# EasyEDA Pro project trumpx-ipadrescreen-ipad34-c6ab9950.epro, board PCB_C
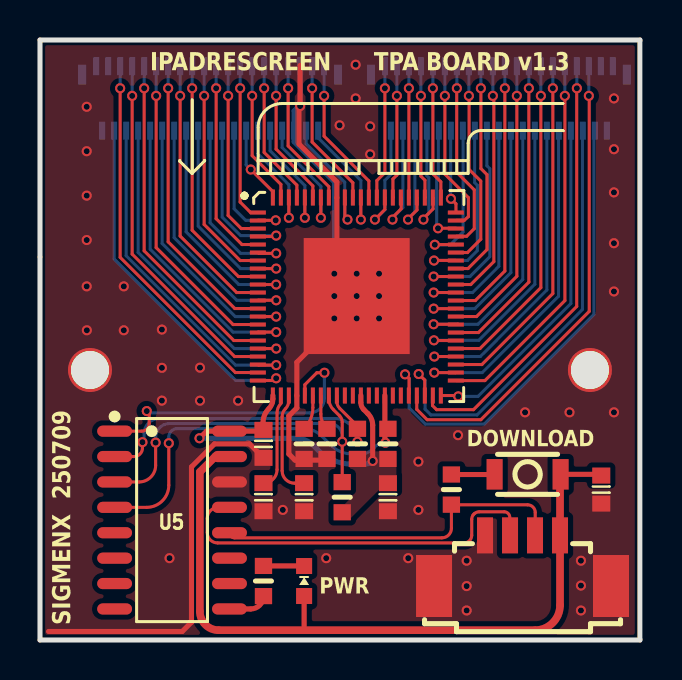
[diagram p8: board, top side]
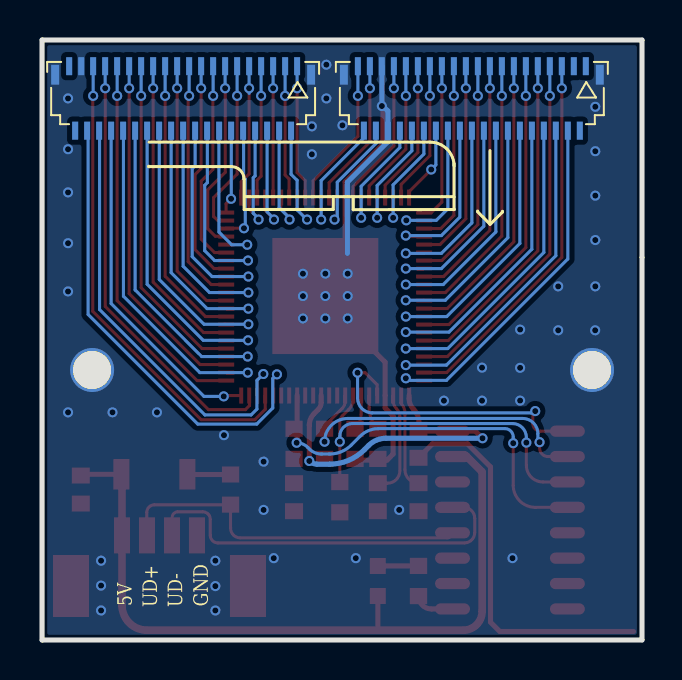
[diagram p9: board, bottom side, seen from below]

Outline 30 x 30 mm; copper layers: Top Layer, Bottom Layer. Coordinates in mm from the lower left corner of the outline.
Outline path: 0,19.15 0,30 30,30 30,0 0,0 0,19.15
Stack: Top Layer 0.035mm / Dielectric1 1.51mm FR4 er 4.5 / Bottom Layer 0.035mm

## Design rules (mm)
spacing copperThickness1oz (default): track to track 0.102, other pairs 0.152 to 0.3
spacing copperThickness2oz: track to track 0.203, other pairs 0.152 to 0.3
spacing Plane_innerPlane: track to track 0.102, other pairs 0.152 to 0.3
spacing Copper_copperRegion: track to track 0.102, other pairs 0.152 to 0.3
track width copperThickness1oz (default): min 0.127, default 0.254, max 2.54
track width copperThickness2oz: min 0.203, default 0.254, max 2.54
differential pair differentialPair (default): width min 0.127, default 0.254, max 2.54; gap min 0.152, default 0.152
pour e641 uses Copper_copperRegion
pour e643 uses Copper_copperRegion
pour e649 uses Copper_copperRegion

## Placement (name value [footprint] x y rotation side)
C1  2.2uF  [c0603_neo]  11.18 9.81 90 top
C2  2.2uF  [c0603_neo]  11.18 7.14 90 top
C3  2.2uF  [c0603_neo]  13.21 7.14 90 top
C5  100nF  [c0603_neo]  28.07 7.52 90 top
C6  100nF  [c0603_neo]  17.4 7.14 90 top
FPC2  1.25-4PWB  [CONN-SMD_1.25-4PWB]  24.13 3.97 0 top
LED1  KT-0603W  [LED0603]  13.21 2.95 90 top
NOREF  -  [Pad_e132]  27.5 13.5 0 top
NOREF#2  -  [Pad_e131]  2.5 13.5 0 top
R1  10kΩ  [r0603_neo]  20.57 7.52 90 top
R2  4.7K  [r0603_neo]  15.11 7.14 270 top
R3  4.7K  [r0603_neo]  15.88 9.81 270 top
R4  10K  [r0603_neo]  17.4 9.81 90 top
R5  1kΩ  [r0603_neo]  13.21 9.81 270 top
R6  1kΩ  [r0603_neo]  14.35 9.81 270 top
R7  1kΩ  [r0603_neo]  11.18 2.95 270 top
U1  -  [GT9110]  15.85 17.17 0 top
U2  FH26-39S-0.3SHW  [CONN-SMD_FH26-39S-0.3SHW]  22.95 27.08 0 bottom
U3  FH26-39S-0.3SHW  [CONN-SMD_FH26-39S-0.3SHW]  8.51 27.08 0 bottom
U4  TS2306A 200gf 002  [SW-SMD_L3.0-W2.0-LS3.5]  24.38 8.28 0 top
U5  CH554G  [SOP-16_L10.0-W3.9-P1.27-LS6.0-BL]  6.6 6 270 top

## Footprints (pads in the part's own frame, mm; a bottom-side part is the same pattern mirrored in y, then rotated)
c0603_neo
  rect 0.8x0.9 smd: 1(-0.7,0) 2(0.7,0)
CONN-SMD_1.25-4PWB
  rect 0.8x1.8 smd: 1(-1.875,1.266) 2(-0.625,1.266) 3(0.625,1.266) 4(1.875,1.266)
  rect 1.8x3.1 smd: 5(-4.425,-1.266) 6(4.425,-1.266)
CONN-SMD_FH26-39S-0.3SHW
  rect 0.3x0.9 smd: 1(-5.699,-1.613) 2(-5.399,1.613) 3(-5.099,-1.613) 4(-4.8,1.613) 5(-4.5,-1.613) 6(-4.199,1.613) 7(-3.9,-1.613) 8(-3.6,1.613) 9(-3.3,-1.613) 10(-3,1.613) 11(-2.7,-1.613) 12(-2.4,1.613) 13(-2.1,-1.613) 14(-1.8,1.613) 15(-1.5,-1.613) 16(-1.2,1.613) 17(-0.9,-1.613) 18(-0.6,1.613) 19(-0.3,-1.613) 20(0,1.613) 21(0.299,-1.613) 22(0.6,1.613) 23(0.899,-1.613) 24(1.2,1.613) 25(1.5,-1.613) 26(1.8,1.613) 27(2.1,-1.613) 28(2.4,1.613) 29(2.7,-1.613) 30(2.999,1.613) 31(3.3,-1.613) 32(3.599,1.613) 33(3.9,-1.613) 34(4.199,1.613) 35(4.5,-1.613) 36(4.8,1.613) 37(5.099,-1.613) 38(5.399,1.613) 39(5.699,-1.613)
  rect 0.4x1 smd: 40(-6.399,-1.188) 41(6.399,-1.188)
GT9110
  rect 0.8x0.2 smd: 1(-4.95,4.2) 2(-4.95,3.8) 3(-4.95,3.4) 4(-4.95,3) 5(-4.95,2.6) 6(-4.95,2.2) 7(-4.95,1.8) 8(-4.95,1.4) 9(-4.95,1) 10(-4.95,0.6) 11(-4.95,0.2) 12(-4.95,-0.2) 13(-4.95,-0.6) 14(-4.95,-1) 15(-4.95,-1.4) 16(-4.95,-1.8) 17(-4.95,-2.2) 18(-4.95,-2.6) 19(-4.95,-3) 20(-4.95,-3.4) 21(-4.95,-3.8) 22(-4.95,-4.2) 45(4.95,-4.2) 46(4.95,-3.8) 47(4.95,-3.4) 48(4.95,-3) 49(4.95,-2.6) 50(4.95,-2.2) 51(4.95,-1.8) 52(4.95,-1.4) 53(4.95,-1) 54(4.95,-0.6) 55(4.95,-0.2) 56(4.95,0.2) 57(4.95,0.6) 58(4.95,1) 59(4.95,1.4) 60(4.95,1.8) 61(4.95,2.2) 62(4.95,2.6) 63(4.95,3) 64(4.95,3.4) 65(4.95,3.8) 66(4.95,4.2)
  rect 0.2x0.8 smd: 23(-4.2,-4.95) 24(-3.8,-4.95) 25(-3.4,-4.95) 26(-3,-4.95) 27(-2.6,-4.95) 28(-2.2,-4.95) 29(-1.8,-4.95) 30(-1.4,-4.95) 31(-1,-4.95) 32(-0.6,-4.95) 33(-0.2,-4.95) 34(0.2,-4.95) 35(0.6,-4.95) 36(1,-4.95) 37(1.4,-4.95) 38(1.8,-4.95) 39(2.2,-4.95) 40(2.6,-4.95) 41(3,-4.95) 42(3.4,-4.95) 43(3.8,-4.95) 44(4.2,-4.95) 67(4.2,4.95) 68(3.8,4.95) 69(3.4,4.95) 70(3,4.95) 71(2.6,4.95) 72(2.2,4.95) 73(1.8,4.95) 74(1.4,4.95) 75(1,4.95) 76(0.6,4.95) 77(0.2,4.95) 78(-0.2,4.95) 79(-0.6,4.95) 80(-1,4.95) 81(-1.4,4.95) 82(-1.8,4.95) 83(-2.2,4.95) 84(-2.6,4.95) 85(-3,4.95) 86(-3.4,4.95) 87(-3.8,4.95) 88(-4.2,4.95)
  rect 5.3x5.8 smd: 89(-0.009,0.024)
LED0603
  rect 0.8x0.8 smd: 1(-0.75,0) 2(0.75,0)
Pad_e131
  round 2.2 hole 1.9: 1(0,0)
Pad_e132
  round 2.2 hole 1.9: 1(0,0)
r0603_neo
  rect 0.806x0.864 smd: 1(-0.753,0) 2(0.753,0)
SOP-16_L10.0-W3.9-P1.27-LS6.0-BL
  oval 0.56x1.745 smd: 1(-4.445,-2.873) 2(-3.175,-2.873) 3(-1.905,-2.873) 4(-0.635,-2.873) 5(0.635,-2.873) 6(1.905,-2.873) 7(3.175,-2.873) 8(4.445,-2.873) 9(4.445,2.873) 10(3.175,2.873) 11(1.905,2.873) 12(0.635,2.873) 13(-0.635,2.873) 14(-1.905,2.873) 15(-3.175,2.873) 16(-4.445,2.873)
SW-SMD_L3.0-W2.0-LS3.5
  rect 0.8x1.524 smd: 1(-1.651,0) 2(1.651,0)

## Nets
As in the schematic, except:
GND: C1.1 C2.1 C3.1 C5.1 C6.1 FPC2.1 FPC2.5 FPC2.6 NOREF.1 NOREF#2.1 R5.2 R6.2 U1.26 U1.80 U1.89 U2.37 U2.40 U2.41 U3.34 U3.35 U3.40 U3.41 U5.14

Pads without a net: U1 32 33 35 36 38 39; U2 38 39; U3 1 2; U5 5 6 7 8 10 11

## Via types
v1: diameter 0.505, hole 0.305, Top Layer to Bottom Layer, 130 vias

## Routing (per net, layer and track width the routed paths; a pad name or vN(x,y) marks a point on that pad's centre or on a via; arc(x,y) is an arc through that point)
+5V: length 38.1
  Top Layer w0.254: 13.21,1.95 13.21,0.51 13.22,0.49 ; C5.2 28,8.28 U4.2
  Top Layer w0.381: U5.15 8.76,9.17 8,8.4 8,1.43 arc(8.27,0.77) 8.94,0.49 24.75,0.49 arc(25.64,0.86) 26,1.74 FPC2.4 26,8.25 U4.2
GND: length 53.9
  Top Layer w0.254: C1.1 10.48,9.81 8.73,9.81 7.58,8.66 7.58,0.89 7.11,0.43 0.43,0.43 ; 13.01,28.73 v1(13.01,26.7) 12.95,26.64 12.95,24.79 14.85,22.9 U1.80 14.85,18.19 v1(15.84,17.2) 15.84,16.88 12.85,13.89 U1.26 12.85,11.6 12.45,11.2 12.45,9.3 12.75,8.99 14.29,8.99 R6.2 ; 11.23,9.14 11.22,9.15
  Bottom Layer w0.254: U3.35 v1(13.01,26.7) 12.95,26.7 12.71,26.45 U3.34 12.71,24.91 14.73,22.89 14.73,19.33
  vias: v1(2.34,26.66) v1(2.34,24.44) v1(2.34,22.22) v1(2.34,20) v1(2.34,17.68) v1(2.34,15.49) v1(4.19,17.68) v1(4.19,15.49) v1(6.1,15.52) v1(6.1,13.61) v1(6.1,11.97) v1(6.48,4.09) v1(8,13.62) v1(8,11.97) v1(9.91,11.97) v1(12.14,6.5) v1(14.31,4.09) v1(14.72,18.32) v1(14.72,17.2) v1(14.72,16.08) v1(14.98,25.73) v1(15.78,28.77) v1(15.78,27.08) v1(15.84,18.32) v1(15.84,16.08) v1(16.51,25.68) v1(16.51,24.28) v1(16.96,18.32) v1(16.96,17.2) v1(16.96,16.08) v1(18.41,4.09) v1(18.92,8.92) v1(18.92,6.5) v1(20.91,10.24) v1(21.34,3.97) v1(21.34,2.7) v1(21.34,1.48) v1(24.26,11.38) v1(26.48,11.38) v1(27.05,3.97) v1(27.05,2.72) v1(27.05,1.48) v1(28.7,27.08) v1(28.7,24.54) v1(28.7,22.38) v1(28.7,19.84) v1(28.7,17.43) v1(28.7,11.38)
VDD33: length 17.6
  Top Layer w0.254: 11.11,10.44 U5.16 8.33,10.44 v1(7.98,10.09) ; v1(16.64,8.95) 16.64,10.74 arc(16.58,11.05) 16.4,11.31 16.19,11.52 arc(16.08,11.68) 16.05,11.88 U1.34 ; 11.15,10.53 11.15,10.86 arc(11.23,11.24) 11.44,11.56 arc(11.59,11.79) 11.65,12.05 11.65,12.22
  Bottom Layer w0.254: v1(7.98,10.09) 12.8,10.09 arc(13.27,9.99) 13.66,9.73 13.89,9.51 arc(14.68,8.98) 15.62,8.79 16.25,8.79 arc(16.46,8.83) v1(16.64,8.95)
INT: length 15
  Top Layer w0.152: U1.27 13.25,12.77 13.84,13.36 v1(14.22,13.36) ; U5.1 5.08,10.44 arc(5.35,10.55) 5.46,10.82 5.46,11.32 arc(5.42,11.4) v1(5.34,11.45)
  Bottom Layer w0.152: v1(5.34,11.45) 5.46,11.45 5.54,11.36 13.49,11.36 arc(14.01,11.57) 14.22,12.09 v1(14.22,13.36)
MT_IN0: length 18
  Top Layer w0.152: U1.22 11.7,12.97 v1(11.81,13.09)
  Bottom Layer w0.152: U3.4 3.71,19.05 9.78,12.98 11.71,12.98 v1(11.81,13.09)
MT_IN1: length 18.8
  Top Layer w0.152: U1.21 9.77,13.37 4.01,19.13 v1(4.01,27.59)
  Bottom Layer w0.152: U3.5 v1(4.01,27.59)
MT_IN2: length 16.9
  Top Layer w0.152: U1.20 10.92,13.74 v1(11.81,13.74)
  Bottom Layer w0.152: v1(11.81,13.74) 9.78,13.74 4.31,19.21 U3.6
MT_IN3: length 17.8
  Top Layer w0.152: v1(4.61,27.21) 4.61,19.29 9.73,14.17 U1.19
  Bottom Layer w0.152: U3.7 v1(4.61,27.21)
MT_IN4: length 15.9
  Top Layer w0.152: U1.18 11.81,14.57 v1(11.81,14.57)
  Bottom Layer w0.152: 4.91,25.47 4.91,19.38 9.71,14.57 v1(11.81,14.57)
MT_IN5: length 16.8
  Top Layer w0.152: U1.17 9.69,14.97 5.21,19.46 v1(5.21,27.59)
  Bottom Layer w0.152: U3.9 v1(5.21,27.59)
MT_IN6: length 14.9
  Top Layer w0.152: U1.16 10.92,15.39 v1(11.81,15.39)
  Bottom Layer w0.152: U3.10 5.51,19.54 9.65,15.39 v1(11.81,15.39)
MT_IN7: length 15.8
  Top Layer w0.152: v1(5.81,27.21) 5.81,19.62 9.66,15.77 U1.15
  Bottom Layer w0.152: 5.81,28.69 v1(5.81,27.21)
MT_IN8: length 13.8
  Top Layer w0.152: U1.14 11.81,16.17 v1(11.81,16.17)
  Bottom Layer w0.152: v1(11.81,16.17) 9.77,16.17 6.11,19.83 U3.12
MT_IN9: length 14.7
  Top Layer w0.152: v1(6.41,27.59) 6.41,19.91 9.74,16.57 U1.13
  Bottom Layer w0.152: 6.41,28.69 v1(6.41,27.59)
MT_IN10: length 12.7
  Top Layer w0.152: U1.12 10.91,16.99 v1(11.81,16.99)
  Bottom Layer w0.152: U3.14 6.71,20.12 9.84,16.99 v1(11.81,16.99)
MT_IN11: length 13.6
  Top Layer w0.152: U1.11 9.83,17.37 7.01,20.2 v1(7.01,27.21)
  Bottom Layer w0.152: U3.15 v1(7.01,27.21)
MT_IN12: length 11.6
  Top Layer w0.152: v1(11.81,17.77) U1.10
  Bottom Layer w0.152: 7.31,25.47 7.31,20.41 9.94,17.77 v1(11.81,17.77)
MT_IN13: length 12.5
  Top Layer w0.152: U1.9 9.92,18.17 7.61,20.49 v1(7.61,27.59)
  Bottom Layer w0.152: U3.17 v1(7.61,27.59)
MT_IN14: length 10.5
  Top Layer w0.152: U1.8 10.9,18.57 v1(11.81,18.57)
  Bottom Layer w0.152: v1(11.81,18.57) 10.03,18.57 7.91,20.69 7.91,25.47
MT_IN15: length 11.3
  Top Layer w0.152: v1(8.21,27.21) 8.21,20.78 10.01,18.97 U1.7
  Bottom Layer w0.152: U3.19 v1(8.21,27.21)
MT_IN16: length 9.5
  Top Layer w0.152: U1.6 10.94,19.33 v1(11.81,19.33)
  Bottom Layer w0.152: v1(11.81,19.33) 10.03,19.33 8.51,20.86 U3.20
MT_IN17: length 10.2
  Top Layer w0.152: U1.5 10.1,19.77 8.81,21.06 v1(8.81,27.59)
  Bottom Layer w0.152: U3.21 v1(8.81,27.59)
MT_IN18: length 8.3
  Top Layer w0.152: U1.4 11.76,20.17 v1(11.81,20.22)
  Bottom Layer w0.152: U3.22 9.11,21.14 10.03,20.22 v1(11.81,20.22)
MT_IN19: length 9.2
  Top Layer w0.152: U1.3 10.06,20.57 9.41,21.23 v1(9.41,27.21)
  Bottom Layer w0.152: U3.23 v1(9.41,27.21)
MT_IN20: length 7.1
  Top Layer w0.152: v1(11.79,20.98) 10.91,20.98 U1.2
  Bottom Layer w0.152: U3.24 9.71,21.56 10.29,20.98 v1(11.79,20.98)
MT_IN21: length 7.9
  Top Layer w0.152: U1.1 10.53,21.37 10.01,21.9 v1(10.01,27.59)
  Bottom Layer w0.152: U3.25 v1(10.01,27.59)
MT_IN22: length 3.9
  Top Layer w0.152: v1(10.54,23.52) 11.65,22.42 U1.88
  Bottom Layer w0.152: v1(10.54,23.52) 10.31,23.75 10.31,25.47
MT_IN23: length 7.2
  Top Layer w0.152: v1(10.61,27.21) 10.61,24.22 12.05,22.78 U1.87
  Bottom Layer w0.152: U3.27 v1(10.61,27.21)
MT_IN24: length 6
  Top Layer w0.152: v1(12.45,21.11) U1.86
  Bottom Layer w0.152: v1(12.45,21.11) 12.45,22.76 10.91,24.3 10.91,25.47
MT_IN25: length 7.2
  Top Layer w0.152: U1.85 12.85,22.74 11.21,24.38 v1(11.21,27.59)
  Bottom Layer w0.152: U3.29 v1(11.21,27.59)
MT_IN26: length 6.1
  Top Layer w0.152: U1.84 v1(13.25,21.11)
  Bottom Layer w0.152: v1(13.25,21.11) 13.25,22.72 11.51,24.46 U3.30
MT_IN27: length 7.3
  Top Layer w0.152: v1(11.81,27.21) 11.81,24.54 13.65,22.7 U1.83
  Bottom Layer w0.152: U3.31 v1(11.81,27.21)
MT_IN28: length 6.2
  Top Layer w0.152: U1.82 v1(14.05,21.11)
  Bottom Layer w0.152: v1(14.05,21.11) 14.05,22.69 12.11,24.62 U3.32
MT_IN29: length 7.4
  Top Layer w0.152: v1(12.41,27.59) 12.41,24.7 14.45,22.67 U1.81
  Bottom Layer w0.152: U3.33 v1(12.41,27.59)
MT_OUT0: length 23.8
  Top Layer w0.152: v1(18.26,13.28) 18.46,13.08 18.46,12.33
  Bottom Layer w0.152: v1(18.26,13.28) 18.46,13.07 18.46,11.6 19.27,10.8 22.22,10.8 27.7,16.28 27.7,25.45
MT_OUT1: length 24
  Top Layer w0.152: 18.84,12.21 18.84,11.53 19.36,11.01 22.05,11.01 27.47,16.43 27.47,27.12 27.43,27.16
  Bottom Layer w0.152: U2.35 v1(27.45,27.21)
MT_OUT2: length 22.2
  Top Layer w0.152: v1(18.94,13.3) 19.24,13 19.24,12.21 19.23,12.2
  Bottom Layer w0.152: v1(18.94,13.3) 19.26,12.98 19.26,11.55 19.55,11.25 21.86,11.25 27.13,16.52 27.13,25.48
MT_OUT3: length 21.8
  Top Layer w0.152: 26.84,27.51 26.84,27.51 26.84,16.68 21.68,11.52 19.83,11.52 19.63,11.72 19.63,12.18
  Bottom Layer w0.152: U2.33 v1(26.85,27.59)
MT_OUT4: length 17.1
  Top Layer w0.152: U1.44 20.87,12.22 v1(20.92,12.18)
  Bottom Layer w0.152: 26.55,25.5 26.55,16.82 21.91,12.18 v1(20.92,12.18)
MT_OUT5: length 18.8
  Top Layer w0.152: 20.8,12.97 22.25,12.97 26.25,16.97 26.25,27.13
  Bottom Layer w0.152: U2.31 v1(26.25,27.21)
MT_OUT6: length 17.1
  Top Layer w0.152: 20.78,13.37 20.78,13.37 v1(19.72,13.37)
  Bottom Layer w0.152: v1(19.72,13.37) 22.11,13.37 25.93,17.19 25.93,25.46
MT_OUT7: length 17.7
  Top Layer w0.152: v1(25.65,27.59) 25.65,17.32 22.1,13.77 U1.47
  Bottom Layer w0.152: 25.65,28.69 v1(25.65,27.59)
MT_OUT8: length 16
  Top Layer w0.152: v1(19.72,14.17) U1.48
  Bottom Layer w0.152: U2.28 25.35,17.5 22.02,14.17 v1(19.72,14.17)
MT_OUT9: length 16.6
  Top Layer w0.152: U1.49 22,14.57 25.05,17.62 v1(25.05,27.21)
  Bottom Layer w0.152: U2.27 v1(25.05,27.21)
MT_OUT10: length 15
  Top Layer w0.152: v1(19.7,14.98) 19.71,14.97 U1.50
  Bottom Layer w0.152: U2.26 24.75,17.79 21.94,14.98 v1(19.7,14.98)
MT_OUT11: length 15.5
  Top Layer w0.152: v1(24.45,27.59) 24.45,17.9 21.92,15.37 U1.51
  Bottom Layer w0.152: U2.25 v1(24.45,27.59)
MT_OUT12: length 14.1
  Top Layer w0.152: 20.89,15.8 20.88,15.79 v1(19.68,15.79)
  Bottom Layer w0.152: 24.14,25.58 24.14,18.03 21.9,15.79 v1(19.68,15.79)
MT_OUT13: length 14.4
  Top Layer w0.152: U1.53 21.83,16.17 23.85,18.19 v1(23.85,27.21)
  Bottom Layer w0.152: U2.23 v1(23.85,27.21)
MT_OUT14: length 12.8
  Top Layer w0.152: v1(19.69,16.57) 20.79,16.57 U1.54
  Bottom Layer w0.152: U2.22 23.55,18.37 21.75,16.57 v1(19.69,16.57)
MT_OUT15: length 13.3
  Top Layer w0.152: v1(23.25,27.59) 23.25,18.45 21.77,16.97 U1.55
  Bottom Layer w0.152: U2.21 v1(23.25,27.59)
MT_OUT16: length 11.7
  Top Layer w0.152: U1.56 v1(19.69,17.37)
  Bottom Layer w0.152: v1(19.69,17.37) 21.63,17.37 22.95,18.69 U2.20
MT_OUT17: length 12.1
  Top Layer w0.152: U1.57 21.54,17.77 22.7,18.92 22.7,27.08 22.61,27.17
  Bottom Layer w0.152: U2.19 v1(22.65,27.21)
MT_OUT18: length 10.7
  Top Layer w0.152: U1.58 v1(19.69,18.17)
  Bottom Layer w0.152: U2.18 22.35,23.71 22.49,23.57 22.49,19.17 21.5,18.17 v1(19.69,18.17)
MT_OUT19: length 11.3
  Top Layer w0.152: 20.7,18.57 21.4,18.57 22.35,19.52 22.35,23.27 22.05,23.57 22.05,27.52 22.06,27.53
  Bottom Layer w0.152: U2.17 v1(22.05,27.59)
MT_OUT20: length 9.5
  Top Layer w0.152: 20.81,18.98 19.71,18.98 v1(19.7,18.97)
  Bottom Layer w0.152: 21.74,25.41 21.74,22.87 21.87,22.74 21.87,19.47 21.38,18.97 v1(19.7,18.97)
MT_OUT21: length 10.3
  Top Layer w0.152: 21.46,27.12 21.46,23.53 22.04,22.94 22.04,20.04 21.38,19.37 20.78,19.37
  Bottom Layer w0.152: U2.15 v1(21.45,27.21)
MT_OUT22: length 7.8
  Top Layer w0.152: v1(19.74,19.76) 19.75,19.77 20.82,19.77
  Bottom Layer w0.152: v1(19.74,19.76) 20.52,19.76 21.16,20.4 21.16,25.43 21.12,25.47
MT_OUT23: length 9.6
  Top Layer w0.152: 20.84,27.61 20.84,23.39 21.72,22.51 21.72,20.57 21.33,20.19 20.81,20.19
  Bottom Layer w0.152: U2.13 v1(20.85,27.59)
MT_OUT24: length 4.2
  Top Layer w0.152: v1(20.55,22.06) 20.8,21.81 20.8,21.41
  Bottom Layer w0.152: 20.53,25.47 20.54,25.46 20.54,22.07 v1(20.55,22.06)
MT_OUT25: length 8.6
  Top Layer w0.152: 20.25,27.16 20.25,23.29 21.42,22.12 21.42,21.17 21.22,20.98 20.83,20.98
  Bottom Layer w0.152: U2.11 v1(20.25,27.21)
MT_OUT26: length 5.8
  Top Layer w0.152: 20.81,20.59 19.91,20.59
  Bottom Layer w0.152: 19.92,20.6 19.84,20.67 19.84,23.04 19.92,23.13 19.92,25.46
  vias: v1(19.91,20.59)
MT_OUT27: length 6.7
  Top Layer w0.152: U1.67 20.05,22.91 19.65,23.31 19.65,27.33
  Bottom Layer w0.152: 19.65,27.33 v1(19.65,27.59) U2.9
MT_OUT28: length 6
  Top Layer w0.152: 19.18,20.98 19.18,21.07 19.66,21.55 19.66,22.11 U1.68
  Bottom Layer w0.152: U2.8 19.35,23.21 19.44,23.11 19.44,21.34 19.18,21.07 19.18,20.98
  vias: v1(19.18,21.02)
MT_OUT29: length 6.7
  Top Layer w0.152: v1(19.05,27.21) 19.05,23.19 19.25,22.99 19.25,22.15 19.28,22.12
  Bottom Layer w0.152: U2.7 v1(19.05,27.21)
MT_OUT30: length 5.9
  Top Layer w0.152: U1.70 18.85,22.11 18.85,21.5 18.4,21.05 18.4,20.99
  Bottom Layer w0.152: U2.6 18.75,21.41 18.4,21.06 18.4,20.99
  vias: v1(18.4,21.02)
MT_OUT31: length 6.6
  Top Layer w0.152: 18.47,22.12 18.45,22.12 v1(18.45,27.59)
  Bottom Layer w0.152: U2.5 v1(18.45,27.59)
MT_OUT32: length 6
  Top Layer w0.152: U1.72 18.06,22.11 18.06,21.56 17.63,21.12 17.63,21
  Bottom Layer w0.152: U2.4 18.15,21.62 17.63,21.1 17.63,21
  vias: v1(17.63,21.02)
MT_OUT33: length 6.7
  Top Layer w0.152: 17.68,22.12 17.65,22.15 17.65,23.05 17.85,23.25 v1(17.85,27.21)
  Bottom Layer w0.152: U2.3 v1(17.85,27.21)
MT_OUT34: length 6.1
  Top Layer w0.152: v1(16.75,21.02) 16.75,21.03 17.25,21.52 U1.74
  Bottom Layer w0.152: v1(16.75,21.02) 16.76,21.02 17.25,21.51 17.25,22.98 17.55,23.28 U2.2
MT_OUT35: length 6.7
  Top Layer w0.152: v1(17.25,27.59) 17.25,23.37 16.85,22.97 U1.75
  Bottom Layer w0.152: U2.1 v1(17.25,27.59)
MT_OUT36: length 7.5
  Top Layer w0.152: v1(14.21,27.21) 14.21,25.19 16.45,22.95 U1.76
  Bottom Layer w0.152: U3.39 v1(14.21,27.21)
MT_OUT37: length 6.5
  Top Layer w0.152: U1.77 16.05,20.98
  Bottom Layer w0.152: U3.38 13.91,25.11 16.05,22.97 16.05,20.98
  vias: v1(16.05,21.02)
MT_OUT38: length 7.4
  Top Layer w0.152: U1.78 15.65,22.86 13.61,24.9 v1(13.61,27.59)
  Bottom Layer w0.152: U3.37 v1(13.61,27.59)
MT_OUT39: length 6.5
  Top Layer w0.152: 15.38,20.98 15.25,21.11 U1.79
  Bottom Layer w0.152: 15.38,20.98 15.24,21.12 15.24,22.89 13.31,24.82 U3.36
  vias: v1(15.38,21.02)
OPT1: length 1.8
  Top Layer w0.152: U1.28 13.65,11.62 arc(13.53,11.05) R5.1
OPT2: length 1.7
  Top Layer w0.152: U1.29 14.05,11.3 arc(14.12,10.9) R6.1
RST-TS: length 19.8
  Top Layer w0.152: v1(6.44,9.84) 6.44,7.74 arc(6.12,6.96) 5.33,6.63 U5.4
  Top Layer w0.254: v1(17.27,9.86) 17.25,9.89 U1.37
  Bottom Layer w0.152: v1(6.44,9.84) 6.44,10.15 arc(6.56,10.45) 6.86,10.57 13.18,10.57 arc(13.67,10.47) 14.1,10.19 14.54,9.75 arc(15.03,9.42) 15.62,9.3 16.02,9.3 arc(16.36,9.36) 16.64,9.55 16.72,9.63 arc(16.97,9.8) v1(17.27,9.86)
SCL: length 16.2
  Top Layer w0.152: U1.31 14.85,11.92 arc(14.88,11.74) 14.99,11.59 15.78,10.79 arc(15.85,10.69) R3.1 ; U5.2 4.7,9.17 arc(5,9.3) 5.12,9.6 v1(5.12,9.89)
  Bottom Layer w0.152: v1(15.88,9.91) arc(15.53,10.74) 14.71,11.08 5.97,11.08 arc(5.43,10.85) 5.21,10.31 5.21,9.97 arc(5.18,9.91) v1(5.12,9.89)
SDA: length 18.8
  Top Layer w0.152: 4.32,7.9 4.95,7.9 arc(5.54,8.15) 5.78,8.73 v1(5.78,9.87) ; R2.1 v1(15.11,9.91) 15.11,10.9 arc(15.08,11.06) 14.99,11.2 14.67,11.52 arc(14.5,11.77) 14.45,12.06 U1.30
  Top Layer w0.254: 4.32,7.9 U5.3
  Bottom Layer w0.152: v1(5.78,9.87) 5.78,10.13 arc(5.99,10.62) 6.48,10.82 14.48,10.82 arc(14.93,10.64) 15.11,10.19 v1(15.11,9.91)
UD+: length 18.3
  Top Layer w0.152: 20.58,6.77 20.58,6.76 24.38,6.76 arc(24.65,6.65) 24.77,6.38 24.77,5.24 arc(24.76,5.23) FPC2.3 ; R1.1 20.57,5.59 arc(20.43,5.25) 20.09,5.11 9.73,5.11 arc(9.55,5.18) U5.12
UD-: length 19.6
  Top Layer w0.152: U5.13 8.92,6.63 arc(8.53,6.47) 8.36,6.08 8.36,5.37 arc(8.52,5.01) 8.88,4.85 21.21,4.85 arc(21.48,4.97) 21.59,5.23 21.59,6.03 arc(21.61,6.14) 21.66,6.25 arc(21.68,6.28) 21.71,6.31 arc(21.83,6.38) 21.97,6.41 23.21,6.41 arc(23.41,6.33) 23.5,6.12 ; FPC2.2 23.5,5.41 arc(23.48,5.62) 23.42,5.82
$1N6411: length 4.4
  Top Layer w0.152: 11.85,8.52 11.85,11.35 arc(11.91,11.61) 12.05,11.83 ; 11.85,8.52 arc(11.74,8.14) 11.43,7.89 arc(11.31,7.85) C2.2
$1N6412: length 5.3
  Top Layer w0.152: U1.25 12.45,11.98 arc(12.4,11.75) 12.27,11.56 arc(12.15,11.38) 12.11,11.17 12.11,8.46 arc(12.29,8.02) 12.73,7.84 C3.2
$1N6447: length 2.2
  Top Layer w0.254: R1.2 22.72,8.27 U4.1
$1N6516: length 2.1
  Top Layer w0.254: 9.48,1.55 10.53,1.55 arc(10.99,1.74) R7.2
$1N6523: length 2
  Top Layer w0.254: R7.1 13.2,3.7 arc(13.2,3.7) LED1.2

## Copper pours and planes (outline as drawn; the poured copper is in the pictures)
GND on Top Layer: -2.95,30 30,30 30,0 -2.95,0
GND on Bottom Layer: -2.95,30 30,30 30,0 -2.95,0
VDD33 on Top Layer: 15.45,9.43 17.82,9.43 17.82,7.52 16.97,7.52 15.45,6 15.24,6 15.24,6.8 15.47,7.03 15.47,9.4

## Text on the board
Bottom Silkscreen Layer: GND | UD- | UD+ | 5V
Document Layer: FH26W-39S
Top Silkscreen Layer: PWR | DOWNLOAD | IPADRESCREEN | TPA BOARD v1.3 | SIGMENX  250709
